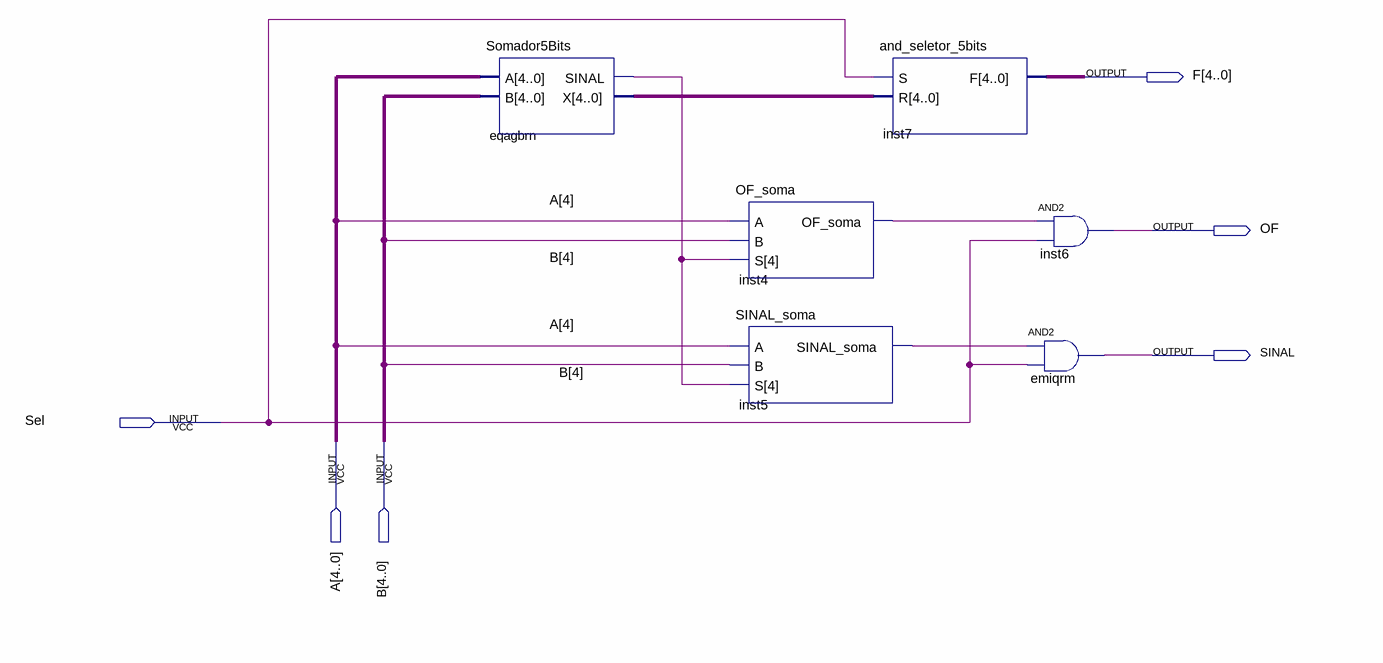
[diagram p0: schematic sheet]
// Quartus schematic bloco_soma.bdf as structural Verilog: 6 symbols, 6 pins
module bloco_soma (
  input  Sel,
  input  [4:0] A,
  input  [4:0] B,
  output [4:0] F,
  output OF,
  output SINAL
);

  wire eqagbrn_sinal, inst4_of_soma, inst5_sinal_soma;
  wire [4:0] eqagbrn_x;

  Somador5Bits eqagbrn (.A(A), .B(B), .SINAL(eqagbrn_sinal), .X(eqagbrn_x));
  OF_soma inst4 (.A(A[4]), .B(B[4]), .S(eqagbrn_sinal), .OF_soma(inst4_of_soma));
  SINAL_soma inst5 (.A(A[4]), .B(B[4]), .S(eqagbrn_sinal), .SINAL_soma(inst5_sinal_soma));
  and_seletor_5bits inst7 (.S(Sel), .R(eqagbrn_x), .F(F));
  and inst6 (OF, inst4_of_soma, Sel);
  and emiqrm (SINAL, inst5_sinal_soma, Sel);
endmodule
